# Altium schematic sheet MCU.SchDoc
size A4; DocumentNumber: 1; SheetNumber: 1; SheetTotal: 15
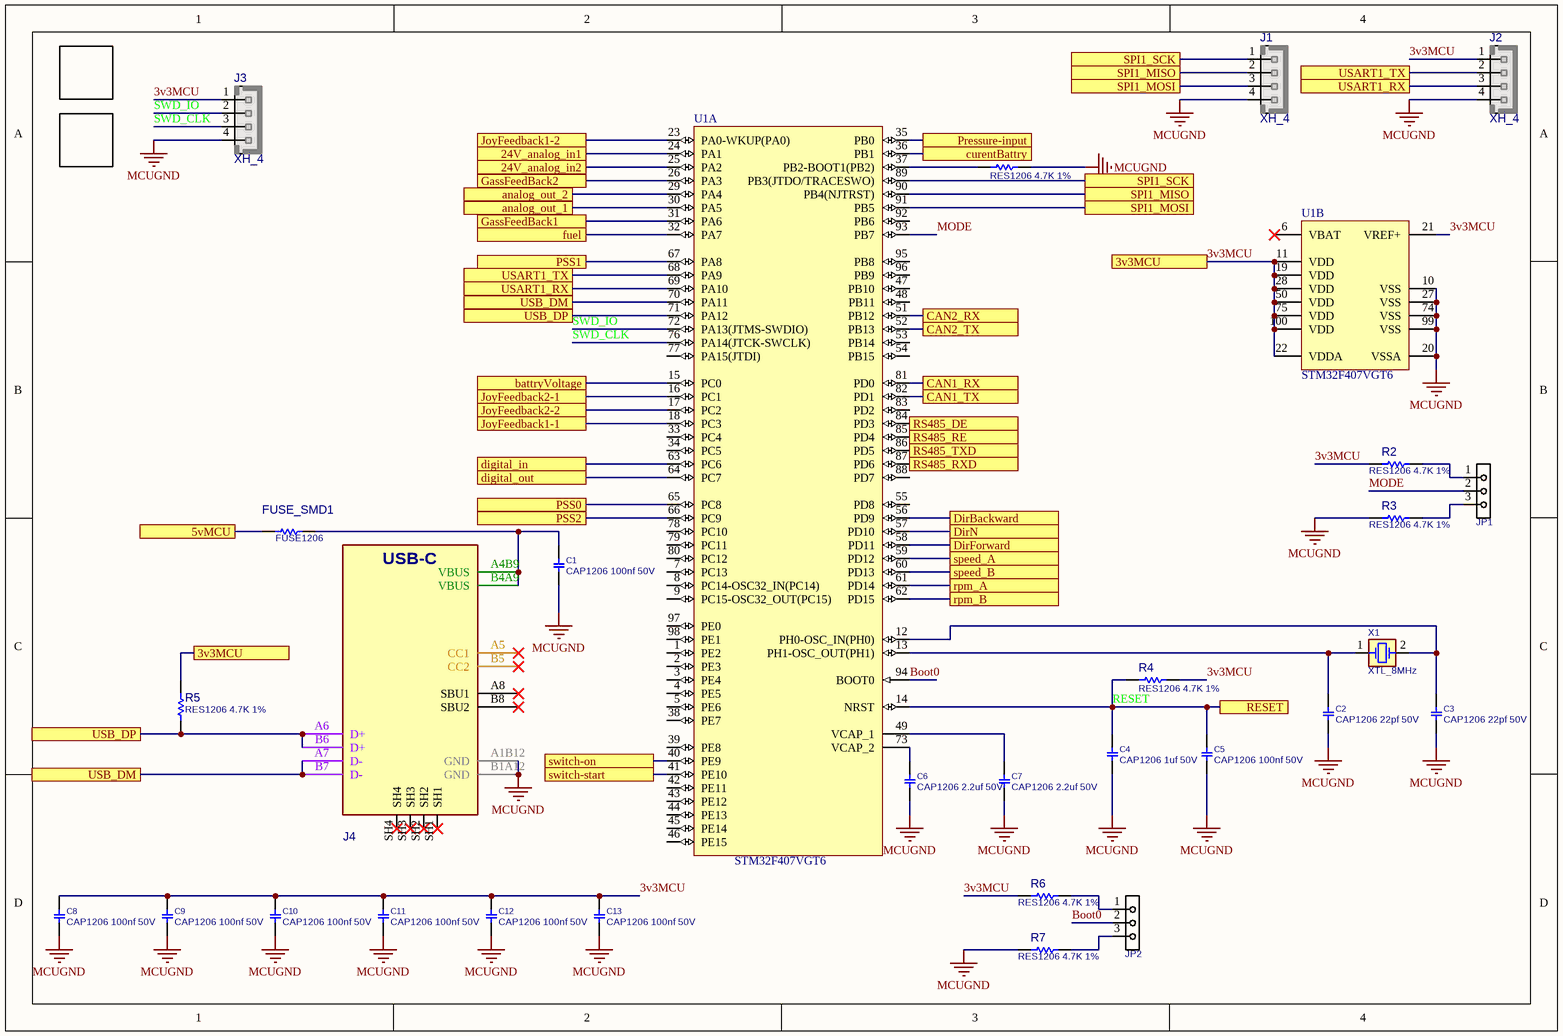
[diagram p0: MCU.SchDoc]

## Parts
C1  CAP1206 100nf 50V  [C1206]
C2  CAP1206 22pf 50V  [C1206]
C3  CAP1206 22pf 50V  [C1206]
C4  CAP1206 1uf 50V  [C1206]
C5  CAP1206 100nf 50V  [C1206]
C6  CAP1206 2.2uf 50V  [C1206]
C7  CAP1206 2.2uf 50V  [C1206]
C8  CAP1206 100nf 50V  [C1206]
C9  CAP1206 100nf 50V  [C1206]
C10  CAP1206 100nf 50V  [C1206]
C11  CAP1206 100nf 50V  [C1206]
C12  CAP1206 100nf 50V  [C1206]
C13  CAP1206 100nf 50V  [C1206]
FUSE_SMD1  FUSE1206  [R1206]
J1  XH_4  [XH_4]
J2  XH_4  [XH_4]
J3  XH_4  [XH_4]
J4  DX07S016JA1  [USBC_SMD_16_DX07S016JA1]  (value not drawn)
JP1  JMPHDR3PIN  [JPH_3]  (value not drawn)
JP2  JMPHDR3PIN  [JPH_3]  (value not drawn)
R1  RES1206 4.7K 1%  [R1206]
R2  RES1206 4.7K 1%  [R1206]
R3  RES1206 4.7K 1%  [R1206]
R4  RES1206 4.7K 1%  [R1206]
R5  RES1206 4.7K 1%  [R1206]
R6  RES1206 4.7K 1%  [R1206]
R7  RES1206 4.7K 1%  [R1206]
RAMON1  WWW.RAMONIC.COM  [PCBComponent_1]  (value not drawn)
RAMON2  WWW.RAMONIC.COM  [PCBComponent_1]  (value not drawn)
U1  STM32F407VGT6  [STM-LQFP100_N]  (parts A,B of 2)
X1  XTL_8MHz  [XTL_2_11X5]

## Ports
3v3MCU, 5vMCU, 24V_analog_in1, 24V_analog_in2, analog_out_1, analog_out_2, battryVoltage, CAN1_RX, CAN1_TX, CAN2_RX, CAN2_TX, curentBattry, digital_in, digital_out, DirBackward, DirForward, DirN, fuel, GassFeedBack1, GassFeedBack2, JoyFeedback1-1, JoyFeedback1-2, JoyFeedback2-1, JoyFeedback2-2, Pressure-input, PSS0, PSS1, PSS2, RESET, rpm_A, rpm_B, RS485_DE, RS485_RE, RS485_RXD, RS485_TXD, speed_A, speed_B, SPI1_MISO, SPI1_MOSI, SPI1_SCK, switch-on, switch-start, USART1_RX, USART1_TX, USB_DM, USB_DP

## Nets
MCUGND: C1.1 C2.1 C3.1 C4.1 C5.1 C6.1 C7.1 C8.1 C9.1 C10.1 C11.1 C12.1 C13.1 J1.4 J2.4 J3.4 J4.A1B12(GND) J4.B1A12(GND) R1.2 R3.2 R7.2 U1.10(VSS) U1.20(VSSA) U1.27(VSS) U1.74(VSS) U1.99(VSS)
3v3MCU: C8.2 C9.2 C10.2 C11.2 C12.2 C13.2 J2.1 J3.1 R2.2 R4.2 R5.1 R6.2 U1.11(VDD) U1.19(VDD) U1.21(VREF+) U1.22(VDDA) U1.28(VDD) U1.50(VDD) U1.75(VDD) U1.100(VDD) ; port 3v3MCU
5vMCU: FUSE_SMD1.1 ; port 5vMCU
24V_analog_in1: U1.24(PA1) ; port 24V_analog_in1
24V_analog_in2: U1.25(PA2) ; port 24V_analog_in2
analog_out_1: U1.30(PA5) ; port analog_out_1
analog_out_2: U1.29(PA4) ; port analog_out_2
battryVoltage: U1.15(PC0) ; port battryVoltage
Boot0: JP2.2 U1.94(BOOT0)
CAN1_RX: U1.81(PD0) ; port CAN1_RX
CAN1_TX: U1.82(PD1) ; port CAN1_TX
CAN2_RX: U1.51(PB12) ; port CAN2_RX
CAN2_TX: U1.52(PB13) ; port CAN2_TX
curentBattry: U1.36(PB1) ; port curentBattry
digital_in: U1.63(PC6) ; port digital_in
digital_out: U1.64(PC7) ; port digital_out
DirBackward: U1.56(PD9) ; port DirBackward
DirForward: U1.58(PD11) ; port DirForward
DirN: U1.57(PD10) ; port DirN
fuel: U1.32(PA7) ; port fuel
GassFeedBack1: U1.31(PA6) ; port GassFeedBack1
GassFeedBack2: U1.26(PA3) ; port GassFeedBack2
JoyFeedback1-1: U1.18(PC3) ; port JoyFeedback1-1
JoyFeedback1-2: U1.23(PA0-WKUP(PA0)) ; port JoyFeedback1-2
JoyFeedback2-1: U1.16(PC1) ; port JoyFeedback2-1
JoyFeedback2-2: U1.17(PC2) ; port JoyFeedback2-2
MODE: JP1.2 U1.93(PB7)
Pressure-input: U1.35(PB0) ; port Pressure-input
PSS0: U1.65(PC8) ; port PSS0
PSS1: U1.67(PA8) ; port PSS1
PSS2: U1.66(PC9) ; port PSS2
RESET: C4.2 C5.2 R4.1 U1.14(NRST) ; port RESET
rpm_A: U1.61(PD14) ; port rpm_A
rpm_B: U1.62(PD15) ; port rpm_B
RS485_DE: U1.84(PD3) ; port RS485_DE
RS485_RE: U1.85(PD4) ; port RS485_RE
RS485_RXD: U1.87(PD6) ; port RS485_RXD
RS485_TXD: U1.86(PD5) ; port RS485_TXD
speed_A: U1.59(PD12) ; port speed_A
speed_B: U1.60(PD13) ; port speed_B
SPI1_MISO: J1.2 U1.90(PB4(NJTRST)) ; port SPI1_MISO
SPI1_MOSI: J1.3 U1.91(PB5) ; port SPI1_MOSI
SPI1_SCK: J1.1 U1.89(PB3(JTDO/TRACESWO)) ; port SPI1_SCK
SWD_CLK: J3.3 U1.76(PA14(JTCK-SWCLK))
SWD_IO: J3.2 U1.72(PA13(JTMS-SWDIO))
switch-on: U1.40(PE9) ; port switch-on
switch-start: U1.41(PE10) ; port switch-start
USART1_RX: J2.3 U1.69(PA10) ; port USART1_RX
USART1_TX: J2.2 U1.68(PA9) ; port USART1_TX
USB_DM: J4.A7(D-) J4.B7(D-) U1.70(PA11) ; port USB_DM
USB_DP: J4.A6(D+) J4.B6(D+) R5.2 U1.71(PA12) ; port USB_DP
NetC1_2: C1.2 FUSE_SMD1.2 J4.A4B9(VBUS) J4.B4A9(VBUS)
NetC2_2: C2.2 U1.13(PH1-OSC_OUT(PH1)) X1.1(OSC1)
NetC3_2: C3.2 U1.12(PH0-OSC_IN(PH0)) X1.2(OSC2)
NetC6_2: C6.2 U1.73(VCAP_2)
NetC7_2: C7.2 U1.49(VCAP_1)
NetJP1_1: JP1.1 R2.1
NetJP1_3: JP1.3 R3.1
NetJP2_1: JP2.1 R6.1
NetJP2_3: JP2.3 R7.1
NetR1_1: R1.1 U1.37(PB2-BOOT1(PB2))

Not connected (* = marked no-connect by the designer): J4 A5(CC1)* A8(SBU1)* B5(CC2)* B8(SBU2)* SH1* SH2* SH3* SH4*; U1 1(PE2) 2(PE3) 3(PE4) 4(PE5) 5(PE6) 6(VBAT)* 7(PC13) 8(PC14-OSC32_IN(PC14)) 9(PC15-OSC32_OUT(PC15)) 33(PC4) 34(PC5) 38(PE7) 39(PE8) 42(PE11) 43(PE12) 44(PE13) 45(PE14) 46(PE15) 47(PB10) 48(PB11) 53(PB14) 54(PB15) 55(PD8) 77(PA15(JTDI)) 78(PC10) 79(PC11) 80(PC12) 83(PD2) 88(PD7) 92(PB6) 95(PB8) 96(PB9) 97(PE0) 98(PE1)

## Notes on the sheet
- (in symbol CONN_USBC_SMD_16_DX07S016JA1) USB-C

## Library data of the parts
C1-C13 = CAP_SMD_MLCC_1206: CAP, MLCC; PARAM: -, -%; MANF_P#: MANF_PART#; PARAM2: -V; PRICE: 100= 1$; MANF: -; ASSEMBLY: ASSEMBLY
FUSE_SMD1 = RES_SMD_1206: resetable fuse; PARAM: 1%, 0.25W; DESC: DESCRIPTION; DIST#: MOUSER; MANF_P#: -; MANF: -; ASSEMBLY: ASSEMBLY; PRICE: -; PARAM2: -; VALUE: FUSE1206
J1-J3 = XH_4: PW10-x-M, JST-BxB-XH-A pitch: 2.5mm, 3A/250v; MANF: JST; MANF_P#: B4B-XH-A; PARAM2: 250v; PARAM: 3.0A; VALUE: XH_4
J4 = CONN_USBC_SMD_16_DX07S016JA1: CONN, USB, Type C, USB 2.0, Right-Angle, SMD; MANF: JAE; MANF_P#: DX07S016JA1R1500; PARAM: 5A; Price: 1.5$; Value: DX07S016JA1
JP1 JP2 = JUMPER_HDR_3P: JUMPER, HEADER 3PIN; MANF: MANF; MANF_P#: MANF_P#; VALUE: JMPHDR3PIN
R1-R7 = RES_SMD_1206: RESISTOR, SMD; PARAM: 1%, 0.25W; DESC: DESCRIPTION; DIST#: MOUSER; MANF_P#: -; MANF: -; ASSEMBLY: ASSEMBLY; PRICE: -; PARAM2: -
RAMON1 RAMON2 = RamonLogo
U1 = STM32F407VGT6: ARM Cortex-M4 32-bit MCU+FPU, 210 DMIPS, 1024 kB Flash, 192 kB Internal RAM, 82 I/Os, 100-pin LQFP, -40 to 85 degC, Tray; Manufacturer: STMicroelectronics; D/A Converter: 2x12-bit; FLASH Size (Prog) (kB): 1024; I/Os (High Current): 82; Internal RAM Size (kB): 192; Operating Frequency(F) (Processor speed) (MHz): 168; Supply Voltage(Vcc) max (V): 3.6; Supply Voltage(Vcc) min (V): 1.8; DatasheetVersion: Rev. 4; PackageVersion: Rev. 1, 06/2013; PackageReference: LQFP100; PackageDescription: 100-Pin Low Profile Quad Flat Package, 14 x 14 mm Body, 0.5 mm Pitch; Supplier 1: Digi-Key; Supplier Part Number 1: 497-11605-ND; Supplier 2: Farnell; Supplier Part Number 2: 2064368; Supplier 3: Newark; Supplier Part Number 3: 73T2333; Supplier 4: Mouser; Supplier Part Number 4: 511-STM32F407VGT6; Core: ARM Cortex-M4; Packing: Tray; Mounting Technology: Surface Mount; PartNumber: STM32F407VGT6; ComponentLink1Description: Manufacturer URL; ComponentLink1URL: http://www.st.com/web/en/home.html; ComponentLink2Description: Datasheet; ComponentLink2URL: http://www.st.com/st-web-ui/static/active/en/resource/technical/document/datasheet/DM00037051.pdf; ComponentLink3Description: Package Specification; ComponentLink3URL: http://www.st.com/st-web-ui/static/active/en/resource/technical/document/data_brief/DM00071938.pdf
X1 = XTL_2_HC49_8MHz_SMD: Crystal MOST POPULAR ABL HC49 PACKAGE; MANF: ABRACON; MANF_P#: ABLS-8.000MHZ-B4-T; PARAM: 8MHz, 18pF, 30PPM, -20~70oC; PRICE: 0.3$; VALUE: XTL_8MHz